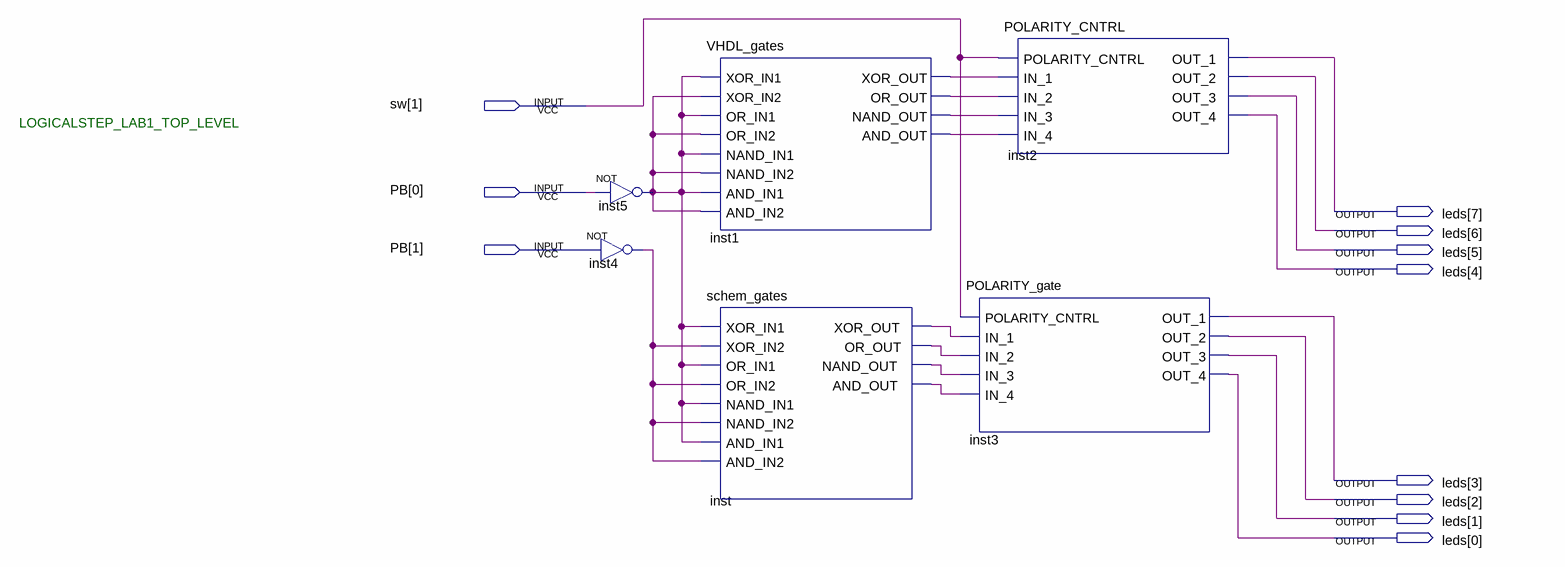
[diagram p0: schematic sheet]
// Quartus schematic LogicalStep_Lab1_top.bdf as structural Verilog: 6 symbols, 11 pins
module LogicalStep_Lab1_top (
  input  [1:1] sw,
  input  [1:0] PB,
  output [7:0] leds
);

  wire inst1_and_out, inst1_nand_out, inst1_or_out, inst1_xor_out, inst4_out, inst5_out, inst_and_out,
       inst_nand_out, inst_or_out, inst_xor_out;

  not inst5 (inst5_out, PB[0]);
  not inst4 (inst4_out, PB[1]);
  VHDL_gates inst1 (
    .XOR_IN1(inst5_out), .XOR_IN2(inst5_out), .OR_IN1(inst5_out), .OR_IN2(inst5_out), .NAND_IN1(inst5_out),
    .NAND_IN2(inst5_out), .AND_IN1(inst5_out), .AND_IN2(inst5_out), .XOR_OUT(inst1_xor_out),
    .OR_OUT(inst1_or_out), .NAND_OUT(inst1_nand_out), .AND_OUT(inst1_and_out));
  schem_gates inst (
    .XOR_IN1(inst5_out), .XOR_IN2(inst4_out), .OR_IN1(inst5_out), .OR_IN2(inst4_out), .NAND_IN1(inst5_out),
    .NAND_IN2(inst4_out), .AND_IN1(inst5_out), .AND_IN2(inst4_out), .XOR_OUT(inst_xor_out),
    .OR_OUT(inst_or_out), .NAND_OUT(inst_nand_out), .AND_OUT(inst_and_out));
  POLARITY_CNTRL inst2 (
    .POLARITY_CNTRL(sw[1]), .IN_1(inst1_xor_out), .IN_2(inst1_or_out), .IN_3(inst1_nand_out),
    .IN_4(inst1_and_out), .OUT_1(leds[7]), .OUT_2(leds[6]), .OUT_3(leds[5]), .OUT_4(leds[4]));
  POLARITY_gate inst3 (
    .POLARITY_CNTRL(sw[1]), .IN_1(inst_xor_out), .IN_2(inst_or_out), .IN_3(inst_nand_out),
    .IN_4(inst_and_out), .OUT_1(leds[3]), .OUT_2(leds[2]), .OUT_3(leds[1]), .OUT_4(leds[0]));

  // Notes on the sheet:
  //   LOGICALSTEP_LAB1_TOP_LEVEL
endmodule
